# EasyEDA Pro project esp32-s3-handheld-jlcpcb-project.epro, schematic Schematic1
Board Name: Board1; Create Date: 2026-09-01; Page Name: P1; Project Name: ESP32-S3（非C3）小智AI; Schematic Name: Schematic1; Update Date: 2026-09-01; Company: 嘉立创EDA; Page Size: A4; Version: V1.0
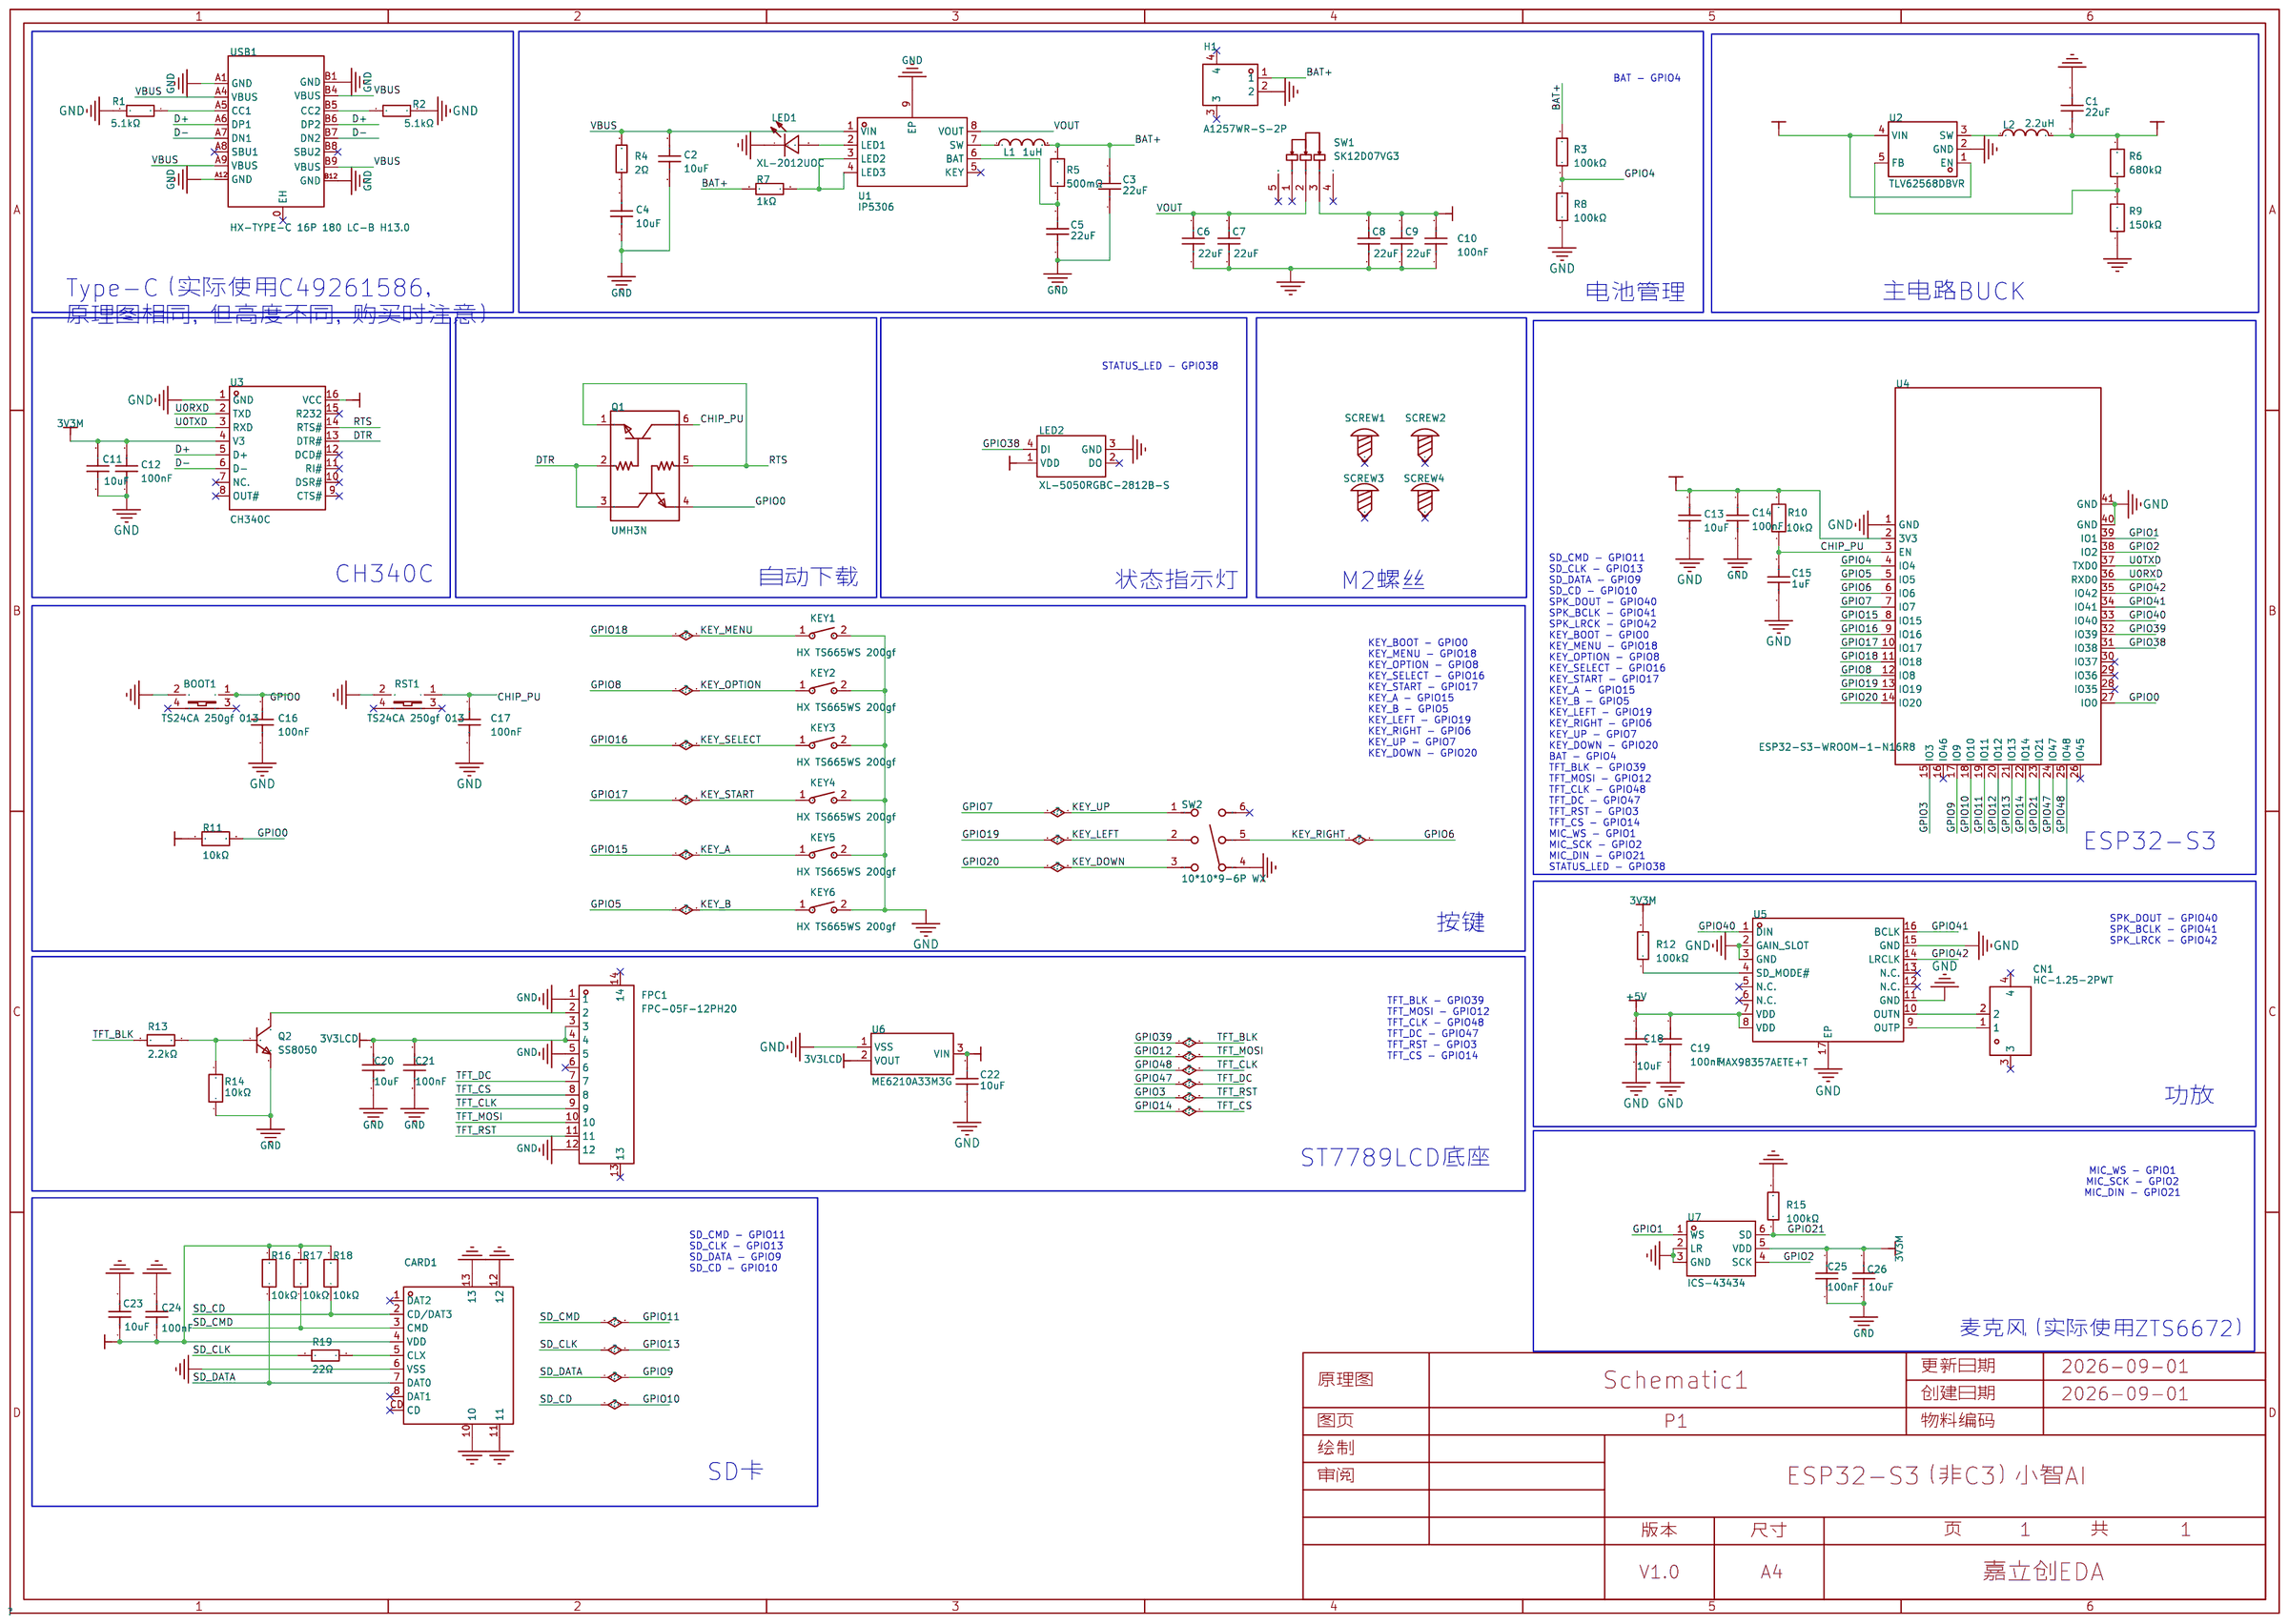
[diagram p0: schematic sheet]

## Parts
BOOT1  TS24CA 250gf 013  [SW-SMD_L4.7-W3.5-P3.35-EH]
C1  22uF  [C0805]
C2  10uF  [C0805]
C3  22uF  [C0805]
C4  10uF  [C0805]
C5  22uF  [C0805]
C6  22uF  [C0805]
C7  22uF  [C0805]
C8  22uF  [C0805]
C9  22uF  [C0805]
C10  100nF  [C0603]
C11  10uF  [C0805]
C12  100nF  [C0603]
C13  10uF  [C0805]
C14  100nF  [C0603]
C15  1uF  [C0805]
C16  100nF  [C0603]
C17  100nF  [C0603]
C18  10uF  [C0805]
C19  100nF  [C0603]
C20  10uF  [C0805]
C21  100nF  [C0603]
C22  10uF  [C0805]
C23  10uF  [C0805]
C24  100nF  [C0603]
C25  100nF  [C0603]
C26  10uF  [C0805]
CARD1  TF PUSH  [TF-SMD_TF-PUSH]
CN1  HC-1.25-2PWT  [CONN-SMD_2P-P1.25-HC-1.25-2PWT]
FPC1  FPC-05F-12PH20  [FPC-SMD_12P-P0.50_FPC-05F-12PH20]
H1  A1257WR-S-2P  [CONN-SMD_A1257WR-S-2P]
KEY1  HX TS665WS 200gf  [KEY-SMD_L6.0-W6.0-LS6.6]
KEY2  HX TS665WS 200gf  [KEY-SMD_L6.0-W6.0-LS6.6]
KEY3  HX TS665WS 200gf  [KEY-SMD_L6.0-W6.0-LS6.6]
KEY4  HX TS665WS 200gf  [KEY-SMD_L6.0-W6.0-LS6.6]
KEY5  HX TS665WS 200gf  [KEY-SMD_L6.0-W6.0-LS6.6]
KEY6  HX TS665WS 200gf  [KEY-SMD_L6.0-W6.0-LS6.6]
L1  1uH  [L0805]
L2  2.2uH  [IND-SMD_L3.0-W3.0_FNR30XXS]
LED1  XL-2012UOC  [LED0805-RD_ORANGE]
LED2  XL-5050RGBC-2812B-S  [LED-SMD_4P-L5.0-W5.0-TL-1]
Q1  UMH3N  [SC-70-6_L2.2-W1.3-P0.65-LS2.1-BR]
Q2  SS8050  [SOT-23-3_L2.9-W1.3-P1.90-LS2.4-BR]
R1  5.1kΩ  [R0805]
R2  5.1kΩ  [R0805]
R3  100kΩ  [R0603]
R4  2Ω  [R0603]
R5  500mΩ  [R0603]
R6  680kΩ  [R0603]
R7  1kΩ  [R0805]
R8  100kΩ  [R0603]
R9  150kΩ  [R0603]
R10  10kΩ  [R0805]
R11  10kΩ  [R0805]
R12  100kΩ  [R0603]
R13  2.2kΩ  [R0603]
R14  10kΩ  [R0805]
R15  100kΩ  [R0603]
R16  10kΩ  [R0805]
R17  10kΩ  [R0805]
R18  10kΩ  [R0805]
R19  22Ω  [R0603]
RST1  TS24CA 250gf 013  [SW-SMD_L4.7-W3.5-P3.35-EH]
SCREW1  -  [M2螺丝]
SCREW2  -  [M2螺丝]
SCREW3  -  [M2螺丝]
SCREW4  -  [M2螺丝]
SW1  SK12D07VG3  [SW-TH_SK12D07VG3]
SW2  10*10*9-6P WX  [SW-SMD-6P-L10.5-W10.0_C2858290]
U1  IP5306  [ESOP-8_L4.9-W3.9-P1.27-LS6.0-BL-EP]
U2  TLV62568DBVR  [SOT-23-5_L3.0-W1.7-P0.95-LS2.8-BR]
U3  CH340C  [SOP-16_L10.0-W3.9-P1.27-LS6.0-BL]
U4  ESP32-S3-WROOM-1-N16R8  [WIRELM-SMD_ESP32-S3-WROOM-1]
U5  MAX98357AETE+T  [TQFN-16_L3.0-W3.0-P0.50-BL-EP1.5]
U6  ME6210A33M3G  [SOT-23-3_L3.0-W1.7-P0.95-LS2.9-BR]
U7  ICS-43434  [MIC-SMD_6P-L3.5-W2.7-P0.90-BL]
USB1  HX-TYPE-C 16P 180 LC-B H13.0  [USB-C-TH_TYPE-C16PLCH10.0-B143]

## Library data of the parts
BOOT1 RST1 = TS24CA 250gf 013: 电路结构:单刀单掷;按钮形状:矩形按钮;作用力:2.5N;安装方式:卧贴;开关长度:4.7mm;开关宽度:1.9mm;开关高度:3.5mm;带支架:不带支架;触点电流:50mA;额定电压:12V;带灯:无;工作寿命:3万次;; LCSC Part Name: 4.55*1.8*3.5mm 卧贴 轻触开关; Supplier Part: C5373430; Manufacturer: SHOU HAN(首韩); Supplier Footprint: SMD; JLCPCB Part Class: Extended Part; Datasheet: https://item.szlcsc.com/datasheet/TS24CA%2520250gf%2520013/6227347.html; Supplier: LCSC; Circuit: 单刀单掷; Actuator Style: 矩形按钮; Operating Force: 2.5N; Mounting Type: 卧贴; Length: 4.7mm; Width: 1.9mm; Switch Height: 3.5mm; with Bracket: 不带支架; Contact Current: 50mA; Voltage Rating: 12V; Actuator/Cap Color: 黑色; With Lamp: 无; Termination Style: SMD接片; Life: 3万次; Operating Temperature: -25℃~+70℃
C1 C3 C5-C9 = CL21A226MAQNNNE: 容值:22uF;精度:±20%;额定电压:25V;温度系数:X5R;; LCSC Part Name: 22uF ±20% 25V; Supplier Part: C45783; Manufacturer: SAMSUNG(三星); Supplier Footprint: 0805; JLCPCB Part Class: Basic Part; Datasheet: https://item.szlcsc.com/datasheet/CL21A226MAQNNNE/46786.html; Supplier: LCSC; Tolerance: ±20%; Voltage Rating: 25V; Temperature Coefficient: X5R
C2 C4 C11 C13 C18 C20 C22 C23 C26 = CGA0805X5R106K250MT: 容值:10uF;精度:±10%;额定电压:25V;温度系数:X5R;; LCSC Part Name: 10uF ±10% 25V; Supplier Part: C6119887; Manufacturer: HRE(芯声); Supplier Footprint: 0805; JLCPCB Part Class: 扩展库; Supplier: LCSC; Tolerance: ±10%; Voltage Rating: 25V; Temperature Coefficient: X5R
C10 C12 C14 C16 C17 C19 C21 C24 C25 = CL10B104KB8NNNC: 容值:100nF;精度:±10%;额定电压:50V;温度系数:X7R;; LCSC Part Name: 100nF ±10% 50V; Supplier Part: C1591; Manufacturer: SAMSUNG(三星); Supplier Footprint: 0603; JLCPCB Part Class: Extended Part; Datasheet: https://item.szlcsc.com/datasheet/CL10B104KB8NNNC/1943.html; Supplier: LCSC; Tolerance: ±10%; Voltage Rating: 50V; Temperature Coefficient: X7R
C15 = CGA0805X7R105K500MT: 容值:1uF;精度:±10%;额定电压:50V;温度系数:X7R;; LCSC Part Name: 1uF ±10% 50V; Supplier Part: C6119929; Manufacturer: HRE(芯声); Supplier Footprint: 0805; JLCPCB Part Class: Extended Part; Datasheet: https://item.szlcsc.com/datasheet/CGA0805X7R105K500MT/7062635.html; Supplier: LCSC; Tolerance: ±10%; Voltage Rating: 50V; Temperature Coefficient: X7R
CARD1 = TF PUSH: 卡连接方式:自弹式;卡类型:MicroSD卡(TF卡);连接器类型:卡座;本体最大高度:2mm;工作温度:-25℃~+90℃;; LCSC Part Name: 自弹式 MicroSD卡(TF卡) 卡座; Supplier Part: C393941; Manufacturer: SHOU HAN(首韩); Supplier Footprint: SMD; JLCPCB Part Class: Extended Part; Datasheet: https://item.szlcsc.com/datasheet/TF%2520PUSH/372553.html; Supplier: LCSC; Card Connection Mode: 自弹式; Card Type: MicroSD卡(TF卡); Connector Type: 卡座; Additional Card Detection Pins: 无; Height Above Board: 2mm; Operating Temperature: -25℃~+90℃
CN1 = HC-1.25-2PWT: 插针结构:1x2P;间距:1.25mm;安装方式:卧贴;参考系列:PicoBlade(MX 1.25);总PIN数:2P;排数:1;每排PIN数:2;行距:-;额定电流:1A;触头材质:黄铜;触头镀层:锡;工作温度范围:-40℃~+105℃;; LCSC Part Name: 1x2P 间距:1.25mm 卧贴 系列:PicoBlade(MX 1.25); Supplier Part: C2845379; Manufacturer: HCTL(华灿天禄); Supplier Footprint: SMD,P=1.25mm,卧贴; JLCPCB Part Class: 扩展库; Datasheet: https://atta.szlcsc.com/upload/public/pdf/source/20240930/9508A8292CCC87B0C29E3A028D56E30A.pdf; Supplier: LCSC; Pins Structure: 1x2P; Pitch: 1.25mm; Mounting Style: 卧贴; Reference Series: PicoBlade(MX 1.25); Number of Pins: 2P; Number of Rows: 1; Number of PINs Per Row: 2; Current Rating (Max): 1A; Contact Material: 黄铜; Contact Plating: 锡; Operating Temperature Range: -40℃~+105℃; Rated Voltage (Max): 125V; Plastic Material: LCP; Flame Retardant Rating: UL94V-0; Supplementary Features: 辅助焊脚; Z-Height of the Board: 3.57mm; X-Length of Bottom Edge on Board (Spacing Line): 7.55mm; Y-Width of Bottom Edge on Board: 5.25mm
FPC1 = FPC-05F-12PH20: 锁定特性:翻盖式;触点类型:卧贴;触点数量:12P;间距:0.5mm;安装方式:下接;工作温度:-25℃~+85℃;; LCSC Part Name: 翻盖式 卧贴 P数:12P 间距:0.5mm; Supplier Part: C2856799; Manufacturer: XUNPU(讯普); Supplier Footprint: SMD,P=0.5mm,卧贴; JLCPCB Part Class: Extended Part; Datasheet: https://item.szlcsc.com/datasheet/FPC-05F-12PH20/3056897.html; Supplier: LCSC; Locking Feature: 翻盖式; Contact Type: 卧贴; Number of Contacts: 12P; Pitch: 0.5mm; Mounting Type: 下接; FFC, FCB Thickness: 0.3mm; Height Above Board: 2mm; Contact Material: 磷青铜; Contact Plating: 锡; Operating Temperature: -25℃~+85℃; Rated Voltage (Max): 50V; Current Rating (Max): 500mA
H1 = A1257WR-S-2P: 插针结构:1x2P;间距:1.25mm;安装方式:卧贴;参考系列:GH;总PIN数:2P;排数:1;每排PIN数:2;行距:-;额定电流:1A;触头材质:磷铜;触头镀层:锡;工作温度:-40℃~+105℃;; LCSC Part Name: 1x2P 间距:1.25mm 卧贴 系列:GH; Supplier Part: C225125; Manufacturer: CJT(长江连接器); Supplier Footprint: SMD,P=1.25mm,卧贴; JLCPCB Part Class: Extended Part; Datasheet: https://item.szlcsc.com/datasheet/A1257WR-S-2P/225408.html; Supplier: LCSC; Pins Structure: 1x2P; Pitch: 1.25mm; Mounting Type: 卧贴; Reference Series: GH; Number of Pins: 2P; Number of Rows: 1; Number of PINs Per Row: 2; Current Rating: 1A; Contact Material: 磷铜; Contact Plating: 锡; Operating Temperature: -40℃~+105℃; Voltage Rating: 50V; Plastic Material: PA9T; Flame Retardant Rating: UL94V-0
KEY1-KEY6 = HX TS665WS 200gf: 开关长度:6mm;开关宽度:6mm;开关高度:5mm;机械寿命:-;; LCSC Part Name: 6*6*5mm 贴片 轻触开关; Supplier Part: C5143657; Manufacturer: hanxia(韩下); Supplier Footprint: SMD; JLCPCB Part Class: Extended Part; Datasheet: https://atta.szlcsc.com/upload/public/pdf/source/20220824/E3A0D3616D5973F89F10D1A814F7F507.pdf; Supplier: LCSC; Circuit: 单刀单掷; Actuator Style: 圆形按钮; Operating Force: 2N; Mounting Type: 立贴; Length: 6mm; Width: 6mm; Switch Height: 5mm; with Bracket: 不带支架; Contact Current: 50mA; Voltage Rating: 12V; Actuator/Cap Color: 灰色; With Lamp: 无; Termination Style: SMD接片; Life: 10万次; Operating Temperature: -40℃~+85℃; Switch Length: 6mm; Switch Width: 6mm
L1 = MLP2012S1R0MT0S1: 电感值:1uH;精度:±20%;额定电流:1A;饱和电流(Isat):-;直流电阻(DCR):160mΩ;; LCSC Part Name: 1uH ±20%; Supplier Part: C383371; Manufacturer: TDK; Supplier Footprint: 0805; JLCPCB Part Class: Extended Part; Datasheet: https://atta.szlcsc.com/upload/public/pdf/source/20190403/C383376_2CC82C33953452D360DB6C4C6709FA52.pdf; Supplier: LCSC; Tolerance: ±20%; Rated Current: 1A; DC Resistance (DCR): 160mΩ
L2 = FNR3015S2R2MT: 电感值:2.2uH;精度:±20%;额定电流:2A;饱和电流(Isat):2A;类型:磁胶屏蔽电感;; LCSC Part Name: 2.2uH ±20% 2A; Supplier Part: C167747; Manufacturer: cjiang(长江微电); Supplier Footprint: SMD,3x3mm; JLCPCB Part Class: Extended Part; Datasheet: https://item.szlcsc.com/datasheet/FNR3015S2R2MT/179130.html; Supplier: LCSC; Tolerance: ±20%; Current Rating: 2A; Current - Saturation(Isat): 2A; DC Resistance(DCR): 78mΩ; Type: 磁胶屏蔽电感
LED1 = XL-2012UOC: 灯头类型:-;发光颜色:橙色;正向压降(Vf):2.3V;功率:50mW;正向电流:20mA;波长:600nm~610nm;二极管配置:独立二极管;透镜颜色:无色透明透镜;色温:-;发光强度:330mcd;发光角度:120°;载带方式:正贴;工作温度:-40℃~+85℃;; LCSC Part Name: 0805橙贴片式发光二极管; Supplier Part: C965813; Manufacturer: XINGLIGHT(成兴光); Supplier Footprint: 0805; JLCPCB Part Class: Extended Part; Datasheet: https://item.szlcsc.com/datasheet/XL-2012UOC/1051422.html; Supplier: LCSC; Illumination Color: 橙色; Voltage - Forward(Vf): 2.3V; Power(Watts): 50mW; Forward Current: 20mA; Wavelength - Dominant: 600nm~610nm; Peak Wavelength: 605nm; Diode Configuration: 独立二极管; Lens Color: 无色透明透镜; Luminous Intensity: 330mcd; Viewing Angle: 120°; Mounting Style: 正贴; Operating Temperature: -40℃~+85℃
LED2 = XL-5050RGBC-2812B-S: 5050幻彩透明普亮  小芯片  内置驱动 IC  WS2812B; LCSC Part Name: 5050幻彩透明普亮（ws2812b); Supplier Part: C22461793; Manufacturer: XINGLIGHT(成兴光); Supplier Footprint: SMD-4P,5x5mm; JLCPCB Part Class: Extended Part; Datasheet: https://item.szlcsc.com/datasheet/XL-5050RGBC-2812B-S/24144343.html; Supplier: LCSC; Wavelength: B:465nm~475nm；R:620nm~630nm；G:515nm~525nm; Luminous Intensity: G:1000mcd~1400mcd；R:400mcd~600mcd；B:200mcd~400mcd; Fixed-Frequency Pwm Mode: 4kHz; Data Transmission Rate: 800Kbit/s; Voltage - Supply: 3.5V~5.5V; Quiescent Current: 0.6mA; Lens Color: 无色透明透镜; ESD Withstand Voltage: 2000V; Operating Temperature: -40℃~+85℃; Viewing Angle: 120°; Length: 5mm; Width: 5mm; Height: 1.6mm
Q1 = UMH3N: 晶体管类型:2个NPN-预偏置;功率(Pd):150mW;集电极电流(Ic):100mA;集射极击穿电压(Vceo):50V;; LCSC Part Name: 2个NPN-预偏置 100mA 50V; Supplier Part: C62892; Manufacturer: CJ(江苏长电/长晶); Supplier Footprint: SC-70-6(SOT-363); JLCPCB Part Class: Extended Part; Datasheet: https://atta.szlcsc.com/upload/public/pdf/source/20151109/1457707575095.pdf; Supplier: LCSC; Collector - Emitter Voltage VCEO: 50V; Current - Collector(Ic): 100mA; Pd - Power Dissipation: 150mW; DC Current Gain: 100@1mA,5V; Emitter-Base Voltage VEBO: 5V; Input Resistor: 6.11kΩ; Operating Temperature: -55℃~+150℃; Transistor Type: 2个NPN-预偏置; Power Dissipation (Pd): 150mW; Collector Current (Ic): 100mA; Collector-Emitter Breakdown Voltage (Vceo): 50V
Q2 = SS8050_C7420370: 晶体管类型:NPN;集电极电流(Ic):1.5A;集射极击穿电压(Vceo):25V;耗散功率(Pd):300mW;直流电流增益(hFE):120@100mA,1.0V;; LCSC Part Name: H档 200-350 NPN 电流:1.5A 电压:25V; Supplier Part: C7420370; Manufacturer: R+O(宏嘉诚); Supplier Footprint: SOT-23; JLCPCB Part Class: Extended Part; Datasheet: https://item.szlcsc.com/datasheet/SS8050/8397192.html; Supplier: LCSC; type: NPN; Current - Collector(Ic): 1.5A; Collector - Emitter Voltage VCEO: 25V; Pd - Power Dissipation: 300mW; DC Current Gain: 120@100mA,1.0V; Transition frequency(fT): 100MHz; Current - Collector Cutoff: 100nA; Vce Saturation(VCE(sat)): 500mV; Operating Temperature: -55℃~+150℃; Emitter-Base Voltage(Vebo): 5V
R1 R2 = 0805W8F5101T5E: 电阻类型:厚膜电阻;阻值:5.1kΩ;精度:±1%;功率:125mW;最大工作电压:150V;温度系数:±100ppm/℃;; LCSC Part Name: 5.1kΩ ±1% 125mW 厚膜电阻; Supplier Part: C27834; Manufacturer: UNI-ROYAL(厚声); Supplier Footprint: 0805; JLCPCB Part Class: 基础库; Datasheet: https://atta.szlcsc.com/upload/public/pdf/source/20200306/C422600_1E6D84923E4A46A82E41ADD87F860B5C.pdf; Supplier: LCSC; Type: 厚膜电阻; Tolerance: ±1%; Power(Watts): 125mW; Overload Voltage (Max): 150V; Temperature Coefficient: ±100ppm/℃; Operating Temperature Range: -55℃~+155℃
R3 R8 R12 R15 = 0603WAF1003T5E: 电阻类型:厚膜电阻;阻值:100kΩ;精度:±1%;功率:100mW;工作电压:75V;温度系数:±100ppm/℃;; LCSC Part Name: 100kΩ ±1% 100mW 厚膜电阻; Supplier Part: C25803; Manufacturer: UNI-ROYAL(厚声); Supplier Footprint: 0603; JLCPCB Part Class: Basic Part; Datasheet: https://item.szlcsc.com/datasheet/0603WAF1003T5E/26546.html; Supplier: LCSC; Type: 厚膜电阻; Tolerance: ±1%; Power(Watts): 100mW; Voltage-Supply(Max): 75V; Temperature Coefficient: ±100ppm/℃; Operating Temperature: -55℃~+155℃
R4 = 0603WAF200KT5E: 电阻类型:厚膜电阻;阻值:2Ω;精度:±1%;功率:100mW;工作电压:75V;温度系数:±200ppm/℃;; LCSC Part Name: 2Ω ±1% 100mW 厚膜电阻; Supplier Part: C22977; Manufacturer: UNI-ROYAL(厚声); Supplier Footprint: 0603; JLCPCB Part Class: Basic Part; Datasheet: https://item.szlcsc.com/datasheet/0603WAF200KT5E/23704.html; Supplier: LCSC; Type: 厚膜电阻; Tolerance: ±1%; Power(Watts): 100mW; Voltage-Supply(Max): 75V; Temperature Coefficient: ±200ppm/℃; Operating Temperature: -55℃~+155℃
R5 = FRL0603JR500TS: 电阻类型:厚膜电阻;阻值:500mΩ;精度:±5%;功率:100mW;工作电压:100V;温度系数:±300ppm/℃;; LCSC Part Name: 500mΩ ±5% 100mW 厚膜电阻; Supplier Part: C2930046; Manufacturer: FOJAN(富捷); Supplier Footprint: 0603; JLCPCB Part Class: Extended Part; Supplier: LCSC; Type: 厚膜电阻; Tolerance: ±5%; Power(Watts): 100mW; Voltage-Supply(Max): 100V; Temperature Coefficient: ±300ppm/℃; Operating Temperature: -55℃~+155℃
R6 = FRC0603F6803TS: 电阻类型:厚膜电阻;阻值:680kΩ;精度:±1%;功率:100mW;工作电压:75V;温度系数:±100ppm/℃;; LCSC Part Name: 680kΩ ±1% 100mW 厚膜电阻; Supplier Part: C2907061; Manufacturer: FOJAN(富捷); Supplier Footprint: 0603; JLCPCB Part Class: Extended Part; Supplier: LCSC; Type: 厚膜电阻; Tolerance: ±1%; Power(Watts): 100mW; Voltage-Supply(Max): 75V; Temperature Coefficient: ±100ppm/℃; Operating Temperature: -55℃~+155℃
R7 = 0805W8F1001T5E: 电阻类型:厚膜电阻;阻值:1kΩ;精度:±1%;功率:125mW;最大工作电压:150V;温度系数:±100ppm/℃;; LCSC Part Name: 1kΩ ±1% 125mW 厚膜电阻; Supplier Part: C17513; Manufacturer: UNI-ROYAL(厚声); Supplier Footprint: 0805; JLCPCB Part Class: 基础库; Datasheet: https://atta.szlcsc.com/upload/public/pdf/source/20200306/C422600_1E6D84923E4A46A82E41ADD87F860B5C.pdf; Supplier: LCSC; Type: 厚膜电阻; Tolerance: ±1%; Power(Watts): 125mW; Overload Voltage (Max): 150V; Temperature Coefficient: ±100ppm/℃; Operating Temperature Range: -55℃~+155℃
R9 = FRC0603F1503TS: 电阻类型:厚膜电阻;阻值:150kΩ;精度:±1%;功率:100mW;工作电压:75V;温度系数:±100ppm/℃;; LCSC Part Name: 150kΩ ±1% 100mW 厚膜电阻; Supplier Part: C2906993; Manufacturer: FOJAN(富捷); Supplier Footprint: 0603; JLCPCB Part Class: Extended Part; Supplier: LCSC; Type: 厚膜电阻; Tolerance: ±1%; Power(Watts): 100mW; Voltage-Supply(Max): 75V; Temperature Coefficient: ±100ppm/℃; Operating Temperature: -55℃~+155℃
R10 R11 R14 R16-R18 = FRC0805J103TS: 电阻类型:厚膜电阻;阻值:10kΩ;精度:±5%;功率:125mW;最大工作电压:150V;温度系数:±100ppm/℃;; LCSC Part Name: 10kΩ ±5% 125mW 厚膜电阻; Supplier Part: C2930231; Manufacturer: FOJAN(富捷); Supplier Footprint: 0805; JLCPCB Part Class: 扩展库; Datasheet: https://atta.szlcsc.com/upload/public/pdf/source/20211221/925EC7D7225764EE0046F22065062C87.pdf; Supplier: LCSC; Type: 厚膜电阻; Tolerance: ±5%; Power(Watts): 125mW; Overload Voltage (Max): 150V; Temperature Coefficient: ±100ppm/℃; Operating Temperature Range: -55℃~+155℃
R13 = AC0603FR-072K2L: 电阻类型:厚膜电阻;阻值:2.2kΩ;精度:±1%;功率:100mW;工作电压:75V;温度系数:±100ppm/℃;; LCSC Part Name: 厚膜电阻 2.2kΩ ±1% 100mW; Supplier Part: C125931; Manufacturer: YAGEO(国巨); Supplier Footprint: 0603; JLCPCB Part Class: Extended Part; Datasheet: https://item.szlcsc.com/datasheet/AC0603FR-072K2L/137211.html; Supplier: LCSC; Type: 厚膜电阻; Tolerance: ±1%; Power(Watts): 100mW; Voltage-Supply(Max): 75V; Temperature Coefficient: ±100ppm/℃; Operating Temperature: -55℃~+155℃
R19 = 0603WAF220JT5E: 电阻类型:厚膜电阻;阻值:22Ω;精度:±1%;功率:100mW;最大工作电压:75V;温度系数:±100ppm/℃;; LCSC Part Name: 22Ω ±1% 100mW 厚膜电阻; Supplier Part: C23345; Manufacturer: UNI-ROYAL(厚声); Supplier Footprint: 0603; JLCPCB Part Class: Basic Part; Datasheet: https://atta.szlcsc.com/upload/public/pdf/source/20200306/C422600_1E6D84923E4A46A82E41ADD87F860B5C.pdf; Supplier: LCSC; Type: 厚膜电阻; Tolerance: ±1%; Power(Watts): 100mW; Overload Voltage (Max): 75V; Temperature Coefficient: ±100ppm/℃; Operating Temperature Range: -55℃~+155℃
SCREW1-SCREW4 = M2螺丝: Supplier Footprint: 插件
SW1 = SK12D07VG3: 电路结构:单刀双掷;安装方式:-;开关颜色:-;额定电流:500mA;额定电压:50V;工作寿命:5千次;; Supplier Part: C431547; Manufacturer: SHOU HAN(首韩); Supplier Footprint: 插件,8.7x4.4mm; JLCPCB Part Class: Extended Part; Datasheet: https://item.szlcsc.com/datasheet/SK12D07VG3/427904.html; Supplier: LCSC; Circuit: 单刀双掷; Termination Style: PC引脚; Length: 8.7mm; Width: 4.4mm; Switch Height: 4.7mm; Current Rating: 500mA; Voltage Rating: 50V; Life: 5千次; Operating Temperature: -10℃~+50℃
SW2 = 10*10*9-6P WX: 10x10x9mm,6脚立贴; LCSC Part Name: 10*10*9-6P贴片五向开关编带; Supplier Part: C2858290; Manufacturer: SHOU HAN(首韩); Supplier Footprint: SMD-6P,10x10mm; JLCPCB Part Class: Extended Part; Datasheet: https://item.szlcsc.com/datasheet/10*10*9-6P%2520WX/3059440.html; Supplier: LCSC; Mounting Type: 立贴; Voltage Rating: 12V; Current Rating: 50mA; Mechanical Life: 5万次; Operating Temperature: -20℃~+70℃
U1 = IP5306: 工作电压:4.65V~5.5V;最大充电电流:2.1A;电池类型:锂电池;电池节数:1;; LCSC Part Name: 集成2.1A充电器和2.1A放电器的全集成移动电源系统级芯片; Supplier Part: C181692; Manufacturer: INJOINIC(英集芯); Supplier Footprint: ESOP-8; JLCPCB Part Class: Extended Part; Datasheet: https://item.szlcsc.com/datasheet/IP5306/193089.html; Supplier: LCSC; The Chip Type: 充电芯片；保护芯片; Voltage - Supply: 4.65V~5.5V; Charge Current - Max: 2.1A; Charging Saturation Voltage: 4.2V; End-Off Voltage: 3V; Type of Battery: 锂电池; Number of Cells: 1; Operating Temperature: 0℃~+70℃; Battery Temperature Detection: 不支持; 0V Battery Charge: 不支持; Supply Current (Iq): 100uA; Interface: I2C; Features: 过流保护；恒流充电；自动再充电；充电终止；过压保护；欠压锁定；过放保护；涓流充电；短路保护
U2 = TLV62568DBVR: 功能类型:降压型;工作电压:2.5V~5.5V;输出电压:600mV~5.5V;输出电流:1A;输出类型:可调;; LCSC Part Name: 1A高效同步降压转换器; Supplier Part: C163219; Manufacturer: TI(德州仪器); Supplier Footprint: SOT-23-5; JLCPCB Part Class: Extended Part; Datasheet: https://www.ti.com/cn/lit/gpn/tlv62568; Supplier: LCSC; Function: 降压型; Voltage - Supply: 2.5V~5.5V; Output Voltage: 600mV~5.5V; Output Current: 1A; Frequency - Switching: 1.5MHz; Operating Temperature: -40℃~+125℃@(TJ); Synchronous Rectifier: 是; Number of Outputs: 1; Topology: 降压式; Quiescent Current: 35uA; Switch tube (built-in/external): 内置; Output Type: 可调
U3 = CH340C: 应用功能:收发器;接口协议:USB 2.0;数据速率:2Mbps;; Supplier Part: C84681; Manufacturer: WCH(南京沁恒); Supplier Footprint: SOP-16; JLCPCB Part Class: 扩展库; Datasheet: https://atta.szlcsc.com/upload/public/pdf/source/20240619/63986D8440D4E5267A77ACD891CC4DE3.pdf; Supplier: LCSC; Applications Function: 收发器; Protocol: USB 2.0; Voltage - Supply: 3.3V；5V; Data Rate: 2Mbps
U4 = ESP32-S3-WROOM-1-N16R8: LCSC Part Name: 通用型Wi-Fi+低功耗蓝牙MCU模组; Supplier Part: C2913202; Manufacturer: ESPRESSIF(乐鑫); Supplier Footprint: SMD,18x25.5mm; JLCPCB Part Class: 扩展库; Datasheet: https://atta.szlcsc.com/upload/public/pdf/source/20241030/6A412B13087E1327DF6279F5735253CA.pdf; Supplier: LCSC
U5 = MAX98357AETE+T: 功放类型:-;扬声器通道数:-;输出功率:-;静态电流(Iq):-;; LCSC Part Name: 微型、低成本、PCM 类 D 级放大器具有 AB 级性能; Supplier Part: C910544; Manufacturer: ADI(亚德诺)/MAXIM(美信); Supplier Footprint: TQFN-16-EP(3x3); JLCPCB Part Class: 扩展库; Datasheet: https://atta.szlcsc.com/upload/public/pdf/source/20210106/C910544_CB6DE4B2CEE254A72E6BDB40E718D281.pdf; Supplier: LCSC; Voltage - Supply: 2.5V~5.5V; Operating Temperature: -40℃~+85℃
U6 = ME6210A33M3G: 输出类型:固定;工作电压:18V;输出电压:3.3V;输出电流:500mA;电源纹波抑制比(PSRR):-;输出极性:正极;; LCSC Part Name: 输入18V 输出3.3V 500mA; Supplier Part: C236680; Manufacturer: MICRONE(南京微盟); Supplier Footprint: SOT23-3; JLCPCB Part Class: Extended Part; Datasheet: https://atta.szlcsc.com/upload/public/pdf/source/20190709/C403652_164B03470289BC6E2EF0FCF22B47472A.pdf; Supplier: LCSC; Output Type: 固定; Voltage - Supply: 18V; Output Voltage: 3.3V; Output Current: 500mA; Voltage Dropout: 10mV@(10mA); standby current: 1.6uA; Features: 短路保护; Operating Temperature: -25℃~+85℃; Output Configuration: 正极; Number of Outputs: 1
U7 = ICS-43434_C5656610: 指向性:全指向;信噪比:64dB;灵敏度:-;; Supplier Part: C5656610; Manufacturer: TDK InvenSense(应美盛); JLCPCB Part Class: 扩展库; Datasheet: https://atta.szlcsc.com/upload/public/pdf/source/231023/DS-000069-ICS-43434-v1.2-8194c7772d771e21a553109502704f97.pdf; Supplier: LCSC; Direction: 全指向; Voltage - Supply: 1.65V~3.63V; Current Consumption: 550uA; S/N Ratio: 64dB
USB1 = HX-TYPE-C 16P 180 LC-B H13.0: 连接器类型:Type-C;协议标准:USB 3.1;公母:母;安装方式:直插;触点数量:16P;端口数量:1;额定电流 - 电源:3A;工作温度:-30℃~+80℃;; LCSC Part Name: Type-C 母 直插; Supplier Part: C49261586; Manufacturer: hanxia(韩下); Supplier Footprint: 插件; JLCPCB Part Class: Extended Part; Datasheet: https://item.szlcsc.com/datasheet/HX-TYPE-C%252016P%2520180%2520LC-B%2520H13.0/51704540.html; Supplier: LCSC; Connector Type: Type-C; Protocol Standard: USB 3.1; Gender: 母; Mounting Type: 直插; Number of Contacts: 16P; Number of Ports: 1; Current Rating-Power: 3A; Voltage Rating: 20V; Connect-Disconnect Life: 1万次; Length: 13mm; Detection color: 黑色; Operating Temperature: -30℃~+80℃

## Nets
3V3LCD: C20.2 C21.1 FPC1.3 FPC1.4 U6.2(VOUT)
3V3M: C1.2 C11.2 C12.2 C13.2 C14.2 C22.1 C23.1 C24.1 C25.1 C26.2 CARD1.4(VDD) L2.2 LED2.1(VDD) R6.2 R10.2 R11.1 R12.2 R16.2 R17.2 R18.2 U3.4(V3) U3.16(VCC) U4.2(3V3) U6.3(VIN) U7.5(VDD)
+5V: C8.2 C9.2 C10.2 C18.1 C19.1 SW1.3 U2.1(EN) U2.4(VIN) U5.7(VDD) U5.8(VDD)
GND: BOOT1.2 C1.1 C2.1 C3.1 C4.1 C5.1 C6.1 C7.1 C8.1 C9.1 C10.1 C11.1 C12.1 C13.1 C14.1 C15.1 C16.2 C17.2 C18.2 C19.2 C20.1 C21.2 C22.2 C23.2 C24.2 C25.2 C26.1 CARD1.6(VSS) CARD1.10 CARD1.11 CARD1.12 CARD1.13 FPC1.1 FPC1.5 FPC1.12 H1.2 KEY1.2 KEY2.2 KEY3.2 KEY4.2 KEY5.2 KEY6.2 LED1.1(-) LED2.3(GND) Q2.2(E) R1.2 R2.1 R8.1 R9.1 R14.1 R15.2 RST1.2 SW2.4 U1.9(EP) U2.2(GND) U3.1(GND) U4.1(GND) U4.40(GND) U4.41(GND) U5.2(GAIN_SLOT) U5.3(GND) U5.11(GND) U5.15(GND) U5.17(EP) U6.1(VSS) U7.2(LR) U7.3(GND) USB1.A1(GND) USB1.A12(GND) USB1.B1(GND) USB1.B12(GND)
VBUS: C2.2 R4.2 U1.1(VIN) USB1.A4(VBUS) USB1.A9(VBUS) USB1.B4(VBUS) USB1.B9(VBUS)
BAT+: C3.2 H1.1 L1.2 R3.2 R5.2 R7.2
CHIP_PU: C15.2 C17.1 Q1.6(C) R10.1 RST1.1 U4.3(EN)
D+: U3.5(D+) USB1.A6(DP1) USB1.B6(DP2)
D-: U3.6(D-) USB1.A7(DN1) USB1.B7(DN2)
DTR: Q1.2(B) Q1.3(C) U3.13(DTR#)
GPIO0: BOOT1.1 C16.1 Q1.4(E) R11.2 U4.27(IO0)
GPIO1: U4.39(IO1) U7.1(WS)
GPIO2: U4.38(IO2) U7.4(SCK)
GPIO3: FPC1.11 U4.15(IO3)
GPIO4: R3.1 R8.2 U4.4(IO4)
GPIO5: KEY6.1 U4.5(IO5)
GPIO6: SW2.5 U4.6(IO6)
GPIO7: SW2.1 U4.7(IO7)
GPIO8: KEY2.1 U4.12(IO8)
GPIO9: CARD1.7(DAT0) R16.1 U4.17(IO9)
GPIO10: CARD1.2(CD/DAT3) R18.1 U4.18(IO10)
GPIO11: CARD1.3(CMD) R17.1 U4.19(IO11)
GPIO12: FPC1.10 U4.20(IO12)
GPIO13: R19.1 U4.21(IO13)
GPIO14: FPC1.8 U4.22(IO14)
GPIO15: KEY5.1 U4.8(IO15)
GPIO16: KEY3.1 U4.9(IO16)
GPIO17: KEY4.1 U4.10(IO17)
GPIO18: KEY1.1 U4.11(IO18)
GPIO19: SW2.2 U4.13(IO19)
GPIO20: SW2.3 U4.14(IO20)
GPIO21: R15.1 U4.23(IO21) U7.6(SD)
GPIO38: LED2.4(DI) U4.31(IO38)
GPIO39: R13.1 U4.32(IO39)
GPIO40: U4.33(IO40) U5.1(DIN)
GPIO41: U4.34(IO41) U5.16(BCLK)
GPIO42: U4.35(IO42) U5.14(LRCLK)
GPIO47: FPC1.7 U4.24(IO47)
GPIO48: FPC1.9 U4.25(IO48)
RTS: Q1.1(E) Q1.5(B) U3.14(RTS#)
U0RXD: U3.2(TXD) U4.36(RXD0)
U0TXD: U3.3(RXD) U4.37(TXD0)
VOUT: C6.2 C7.2 SW1.2 U1.8(VOUT)
$3N34531: Q2.1(B) R13.2 R14.2
$3N34538: FPC1.2 Q2.3(C)
$3N34554: R1.1 USB1.A5(CC1)
$3N34556: R2.2 USB1.B5(CC2)
$3N34586: C5.2 R5.1 U1.6(BAT)
$3N34588: L1.1 U1.7(SW)
$3N34595: LED1.2(+) U1.2(LED1)
$3N34601: R7.1 U1.3(LED2) U1.4(LED3)
$3N34619: C4.2 R4.1
$3N34652: L2.1 U2.3(SW)
$3N34657: R6.1 R9.2 U2.5(FB)
$3N34720: CN1.1 U5.9(OUTP)
$3N34722: CN1.2 U5.10(OUTN)
$3N34731: R12.1 U5.4(SD_MODE#)
$3N34770: CARD1.5(CLX) R19.2

Not connected (* = marked no-connect by the designer): BOOT1 3* 4*; CARD1 1(DAT2)* 8(DAT1)* CD*; CN1 3* 4*; FPC1 6* 13* 14*; H1 3* 4*; LED2 2(DO)*; RST1 3* 4*; SCREW1 1*; SCREW2 1*; SCREW3 1*; SCREW4 1*; SW1 1* 4* 5*; SW2 6*; U1 5(KEY)*; U3 7(NC.)* 8(OUT#)* 9(CTS#)* 10(DSR#)* 11(RI#)* 12(DCD#)* 15(R232)*; U4 16(IO46)* 26(IO45)* 28(IO35)* 29(IO36)* 30(IO37)*; U5 5(N.C.)* 6(N.C.)* 12(N.C.)* 13(N.C.)*; USB1 0(EH)* A8(SBU1)* B8(SBU2)*

## Notes on the sheet
- BAT - GPIO4
- Type-C（实际使用C49261586，
  原理图相同，但高度不同，购买时注意）
- 电池管理
- 主电路BUCK
- STATUS_LED - GPIO38
- SD_CMD - GPIO11
  SD_CLK - GPIO13
  SD_DATA - GPIO9
  SD_CD - GPIO10
  SPK_DOUT - GPIO40
  SPK_BCLK - GPIO41
  SPK_LRCK - GPIO42
  KEY_BOOT - GPIO0
  KEY_MENU - GPIO18
  KEY_OPTION - GPIO8
  KEY_SELECT - GPIO16
  KEY_START - GPIO17
  KEY_A - GPIO15
  KEY_B - GPIO5
  KEY_LEFT - GPIO19
  KEY_RIGHT - GPIO6
  KEY_UP - GPIO7
  KEY_DOWN - GPIO20
  BAT - GPIO4
  TFT_BLK - GPIO39
  TFT_MOSI - GPIO12
  TFT_CLK - GPIO48
  TFT_DC - GPIO47
  TFT_RST - GPIO3
  TFT_CS - GPIO14
  MIC_WS - GPIO1
  MIC_SCK - GPIO2
  MIC_DIN - GPIO21
  STATUS_LED - GPIO38
- CH340C
- 自动下载
- 状态指示灯
- M2螺丝
- KEY_BOOT - GPIO0
  KEY_MENU - GPIO18
  KEY_OPTION - GPIO8
  KEY_SELECT - GPIO16
  KEY_START - GPIO17
  KEY_A - GPIO15
  KEY_B - GPIO5
  KEY_LEFT - GPIO19
  KEY_RIGHT - GPIO6
  KEY_UP - GPIO7
  KEY_DOWN - GPIO20
- ESP32-S3
- SPK_DOUT - GPIO40
  SPK_BCLK - GPIO41
  SPK_LRCK - GPIO42
- 按键
- TFT_BLK - GPIO39
  TFT_MOSI - GPIO12
  TFT_CLK - GPIO48
  TFT_DC - GPIO47
  TFT_RST - GPIO3
  TFT_CS - GPIO14
- 功放
- ST7789LCD底座
- MIC_WS - GPIO1
  MIC_SCK - GPIO2
  MIC_DIN - GPIO21
- SD_CMD - GPIO11
  SD_CLK - GPIO13
  SD_DATA - GPIO9
  SD_CD - GPIO10
- 麦克风（实际使用ZTS6672）
- SD卡
